# Altium schematic sheet CCSL_Schematic.SchDoc
size A4
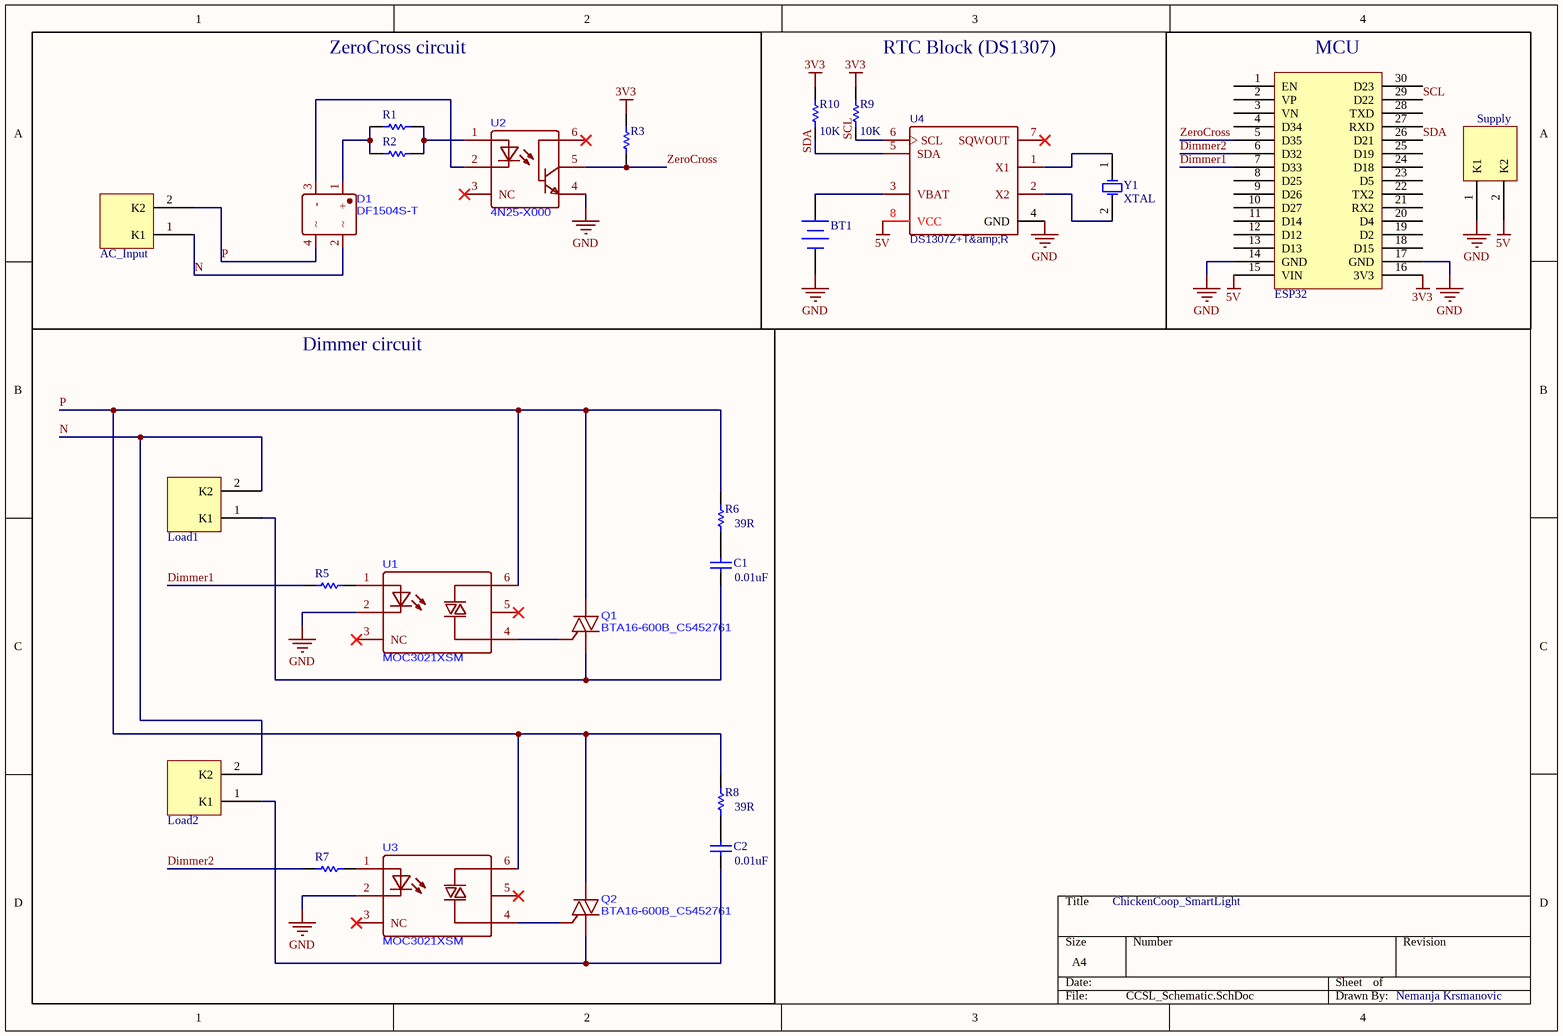
[diagram p0: CCSL_Schematic.SchDoc]

## Parts
AC_Input  Klema  [Klema]  (value not drawn)
BT1  Battery  [BAT-SMD_KEYSTONE-1056]  (value not drawn)
C1  value 0.01uF  [RAD-0.3]  (hidden comment: Cap)
C2  value 0.01uF  [RAD-0.3]  (hidden comment: Cap)
D1  DF1504S-T  [DF-S_L8.4-W6.4-P5.10-LS10.4-TR]
ESP32  ESP32 DEV KIT MODULE  [ESP32]  (value not drawn)
Load1  Klema  [Klema]  (value not drawn)
Load2  Klema  [Klema]  (value not drawn)
Q1  BTA16-600B_C5452761  [TO-220-3_L10.0-W4.5-P2.54-L_1]
Q2  BTA16-600B_C5452761  [TO-220-3_L10.0-W4.5-P2.54-L_1]
R1  Res1  [AXIAL-0.3]  (value not drawn)
R2  Res1  [AXIAL-0.3]  (value not drawn)
R3  Res1  [AXIAL-0.3]  (value not drawn)
R5  Res1  [AXIAL-0.3]  (value not drawn)
R6  value 39R  [AXIAL-0.3]  (hidden comment: Res1)
R7  Res1  [AXIAL-0.3]  (value not drawn)
R8  value 39R  [AXIAL-0.3]  (hidden comment: Res1)
R9  value 10K  [AXIAL-0.3]  (hidden comment: Res1)
R10  value 10K  [AXIAL-0.3]  (hidden comment: Res1)
Supply  Klema  [Klema]  (value not drawn)
U1  MOC3021XSM  [SMD-6_L7.2-W6.4-P2.54-LS10.0-BL]
U2  4N25-X000  [DIP-6_L7.3-W6.5-P2.54-LS7.6-BL]
U3  MOC3021XSM  [SMD-6_L7.2-W6.4-P2.54-LS10.0-BL]
U4  DS1307Z+T&amp;R  [SOIC-8_L5.0-W4.0-P1.27-LS6.0-BL]
Y1  XTAL  [R38]

## Blocks framed on the sheet
ZeroCross circuit: AC_Input D1 R1-R3 U2

## Nets
3V3: ESP32.16(3V3) R3.2 R9.1 R10.1
5V: ESP32.15(VIN) Supply.2(K2) U4.8(VCC)
GND: BT1.2(-) ESP32.14(GND) ESP32.17(GND) Supply.1(K1) U1.2(Cathode) U2.4(E) U3.2(Cathode) U4.4(GND)
Dimmer1: ESP32.7(D33) R5.1
Dimmer2: ESP32.6(D32) R7.1
N: AC_Input.1(K1) D1.2 Load1.2(K2) Load2.2(K2)
P: AC_Input.2(K2) D1.4 Q1.2(T2) Q2.2(T2) R6.2 R8.2 U1.6(Terminal) U3.6(Terminal)
SCL: ESP32.29(D22) R9.2 U4.6(SCL)
SDA: ESP32.26(D21) R10.2 U4.5(SDA)
ZeroCross: ESP32.5(D35) R3.1 U2.5(C)
NetBT1_1: BT1.1(+) U4.3(VBAT)
NetC1_1: C1.1 Load1.1(K1) Q1.1(T1)
NetC1_2: C1.2 R6.1
NetC2_1: C2.1 Load2.1(K1) Q2.1(T1)
NetC2_2: C2.2 R8.1
NetD1_1: D1.1(+) R1.1 R2.1
NetD1_3: D1.3(-) U2.2(C)
NetQ1_3: Q1.3(G) U1.4(Terminal)
NetQ2_3: Q2.3(G) U3.4(Terminal)
NetR1_2: R1.2 R2.2 U2.1(A)
NetR5_2: R5.2 U1.1(ANODE)
NetR7_2: R7.2 U3.1(ANODE)
NetU4_1: U4.1(X1) Y1.1(OSC1)
NetU4_2: U4.2(X2) Y1.2(OSC2)

Not connected (* = marked no-connect by the designer): ESP32 1(EN) 2(VP) 3(VN) 4(D34) 8(D25) 9(D26) 10(D27) 11(D14) 12(D12) 13(D13) 18(D15) 19(D2) 20(D4) 21(RX2) 22(TX2) 23(D5) 24(D18) 25(D19) 27(RXD) 28(TXD) 30(D23); U1 3(NC)* 5(Substrate)*; U2 3(NC)* 6(B)*; U3 3(NC)* 5(Substrate)*; U4 7(SQWOUT)*

## Notes on the sheet
- (near R9) RTC Block (DS1307)
- (near ESP32) MCU
- Dimmer circuit
- Labels drawn without touching a wire or pin: ChickenCoop_SmartLight, Nemanja Krsmanovic

## Library data of the parts
AC_Input Load1 Load2 Supply = Klema: 2 pina
BT1 = Battery: Multicell Battery; Published: 24-Mar-1999; LatestRevisionDate: 17-Jul-2002; LatestRevisionNote: Re-released for DXP Platform.; PackageReference: BAT-2; Publisher: Altium Limited; PackageDescription: Battery; 2 Leads
C1 C2 = Cap: Capacitor; Published: 8-Jun-2000; LatestRevisionDate: 17-Jul-2002; LatestRevisionNote: Re-released for DXP Platform.; PackageReference: RAD-0.3; Publisher: Altium Limited; PackageDescription: Radial Cap, Thru-Hole; 2 Leads; 0.3 in Pin Spacing
ESP32 = ESP32
R1 R2 = Res1: Resistor; Value: 120K; Published: 8-Jun-2000; LatestRevisionDate: 17-Jul-2002; LatestRevisionNote: Re-released for DXP Platform.; PackageReference: AXIAL-0.3; Publisher: Altium Limited; PackageDescription: Axial Device, Thru-Hole; 2 Leads; 0.3 in Pin Spacing
R3 = Res1: Resistor; Value: 10K; Published: 8-Jun-2000; LatestRevisionDate: 17-Jul-2002; LatestRevisionNote: Re-released for DXP Platform.; PackageReference: AXIAL-0.3; Publisher: Altium Limited; PackageDescription: Axial Device, Thru-Hole; 2 Leads; 0.3 in Pin Spacing
R5 R7 = Res1: Resistor; Value: 330; Published: 8-Jun-2000; LatestRevisionDate: 17-Jul-2002; LatestRevisionNote: Re-released for DXP Platform.; PackageReference: AXIAL-0.3; Publisher: Altium Limited; PackageDescription: Axial Device, Thru-Hole; 2 Leads; 0.3 in Pin Spacing
R6 R8-R10 = Res1: Resistor; Published: 8-Jun-2000; LatestRevisionDate: 17-Jul-2002; LatestRevisionNote: Re-released for DXP Platform.; PackageReference: AXIAL-0.3; Publisher: Altium Limited; PackageDescription: Axial Device, Thru-Hole; 2 Leads; 0.3 in Pin Spacing
U4 = DS1307Z+T&amp;R: BOM_Manufacturer: MAXIM; BOM_Manufacturer Part: DS1307Z+T&R; BOM_Supplier: LCSC; BOM_Supplier Part: C9868; BOM_JLCPCB Part Class: Extended Part; spicePre: U; spiceSymbolName: DS1307Z+T&amp;amp;R
Y1 = XTAL: Crystal Oscillator; Published: 8-Jun-2000; LatestRevisionDate: 17-Jul-2002; LatestRevisionNote: Re-released for DXP Platform.; PackageReference: R38; Publisher: Altium Limited; PackageDescription: Crystal, Thru-Hole; 2 Leads; Body 3.1 x 8.2 mm (Dia.xH)